# EasyEDA Pro project SciOly_EV_Controller_and_Encoder.epro, board PCB2
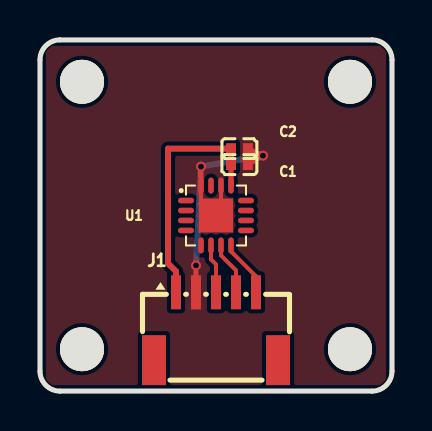
[diagram p5: board, top side]
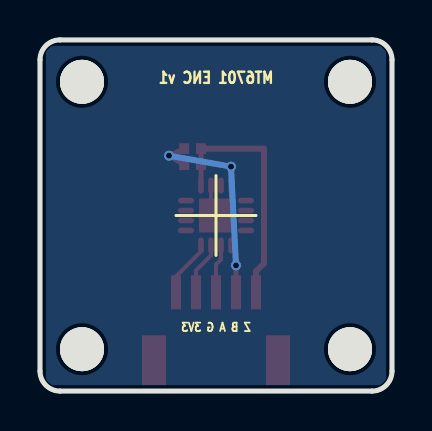
[diagram p6: board, bottom side, seen from below]

Outline 17.6 x 17.6 mm; copper layers: Top Layer, Bottom Layer. Coordinates in mm from the lower left corner of the outline.
Outline path: 0,16.6 0,1 arc(0.29,0.29) 1,0 16.6,0 arc(17.31,0.29) 17.6,1 17.6,16.6 arc(17.31,17.31) 16.6,17.6 1,17.6 arc(0.29,17.31) 0,16.6
Stack: Top Layer 0.035mm / Dielectric1 1.51mm FR4 er 4.5 / Bottom Layer 0.035mm

## Design rules (mm)
spacing copperThickness1oz (default): track to track 0.102, other pairs 0.152 to 0.3
spacing copperThickness2oz: track to track 0.203, other pairs 0.152 to 0.3
track width copperThickness1oz (default): min 0.127, default 0.254, max 2.54
track width copperThickness2oz: min 0.203, default 0.254, max 2.54
differential pair differentialPair (default): width min 0.127, default 0.254, max 2.54; gap min 0.152, default 0.152

## Placement (name value [footprint] x y rotation side)
C1  100nF  [C0402]  9.97 11.35 180 top
C2  1uF  [C0402]  9.97 12.15 180 top
J1  ZX-SH1.0-5PWT  [CONN-SMD_5P-P1.00_MEGASTAR_ZX-SH1.0-5PWT]  8.8 3.25 0 top
NOREF  -  [Pad_e45]  15.5 15.5 0 top
NOREF#2  -  [Pad_e44]  2.1 15.5 0 top
NOREF#3  -  [Pad_e43]  15.5 2.1 0 top
NOREF#4  -  [Pad_e42]  2.1 2.1 0 top
U1  MT6701QT-ACD  [VQFN-16_L3.0-W3.0-P0.50-TL-EP1.7]  8.8 8.8 0 top

## Footprints (pads in the part's own frame, mm; a bottom-side part is the same pattern mirrored in y, then rotated)
C0402
  rect 0.5x0.54 smd: 1(-0.42,0) 2(0.42,0)
CONN-SMD_5P-P1.00_MEGASTAR_ZX-SH1.0-5PWT
  rect 0.5x1.7 smd: 1(-2,1.7) 2(-1,1.7) 3(0,1.7) 4(1,1.7) 5(2,1.7)
  rect 1.2x2.5 smd: 6(3.1,-1.7) 7(-3.1,-1.7)
Pad_e42
  round 2.2 hole 2.2: MH1(0,0)
Pad_e43
  round 2.2 hole 2.2: MH2(0,0)
Pad_e44
  round 2.2 hole 2.2: MH3(0,0)
Pad_e45
  round 2.2 hole 2.2: MH4(0,0)
VQFN-16_L3.0-W3.0-P0.50-TL-EP1.7
  oval 0.8x0.28 smd: 1(-1.5,0.75) 2(-1.5,0.25) 3(-1.5,-0.25) 4(-1.5,-0.75) 9(1.5,-0.75) 10(1.5,-0.25) 11(1.5,0.25) 12(1.5,0.75)
  oval 0.28x0.8 smd: 5(-0.75,-1.5) 6(-0.25,-1.5) 7(0.25,-1.5) 8(0.75,-1.5) 13(0.75,1.5) 14(0.25,1.5) 15(-0.25,1.5) 16(-0.75,1.5)
  rect 1.7x1.7 smd: 17(0,0)

## Nets
As in the schematic.

Pads without a net: J1 6 7; NOREF MH4; NOREF#2 MH3; NOREF#3 MH2; NOREF#4 MH1; U1 1 2 3 4 5 9 10 11 12 15

## Via types
v1: diameter 0.5, hole 0.3, Top Layer to Bottom Layer, 3 vias

## Routing (per net, layer and track width the routed paths; a pad name or vN(x,y) marks a point on that pad's centre or on a via; arc(x,y) is an arc through that point)
+3V3: length 12.4
  Top Layer w0.25: 9.55,10.3 9.55,12.15
  Top Layer w0.3: 6.8,4.95 6.8,6 6.4,6.4 6.4,12.15 9.55,12.15
GND: length 15.5
  Top Layer w0.2: 9.05,10.3 9.05,9.4 ; 8.05,10.3 8.05,9.4
  Top Layer w0.25: 8.05,9.4 U1.17 9.05,9.4 ; 8.05,10.3 v1(8.05,11.25) ; C2.1 v1(11.15,11.8) C1.1 ; 7.8,4.95 v1(7.8,6.3)
  Bottom Layer w0.3: v1(11.15,11.8) v1(8.05,11.25) v1(7.8,6.3)
ENC_A: length 2.5
  Top Layer w0.2: 8.8,4.95 8.8,6.35 8.55,6.6 8.55,7.3
ENC_B: length 2.7
  Top Layer w0.2: 9.05,7.3 9.05,6.8 9.8,6.05 9.8,4.95
ENC_Z: length 2.9
  Top Layer w0.2: 10.8,4.95 10.8,5.75 9.55,7 9.55,7.3

## Copper pours and planes (outline as drawn; the poured copper is in the pictures)
GND on Top Layer: 0.3,17.3 17.3,17.3 17.3,0.3 0.3,0.3
GND on Bottom Layer: 0.3,17.3 17.3,17.3 17.3,0.3 0.3,0.3

## Text on the board
Bottom Silkscreen Layer: Z B A G 3V3 | MT6701 ENC v1
